# Altium schematic sheet MONO65_A2_s05 [Switches-2].SchDoc
size A3; DocumentNumber: 5; SheetNumber: 5; SheetTotal: 7
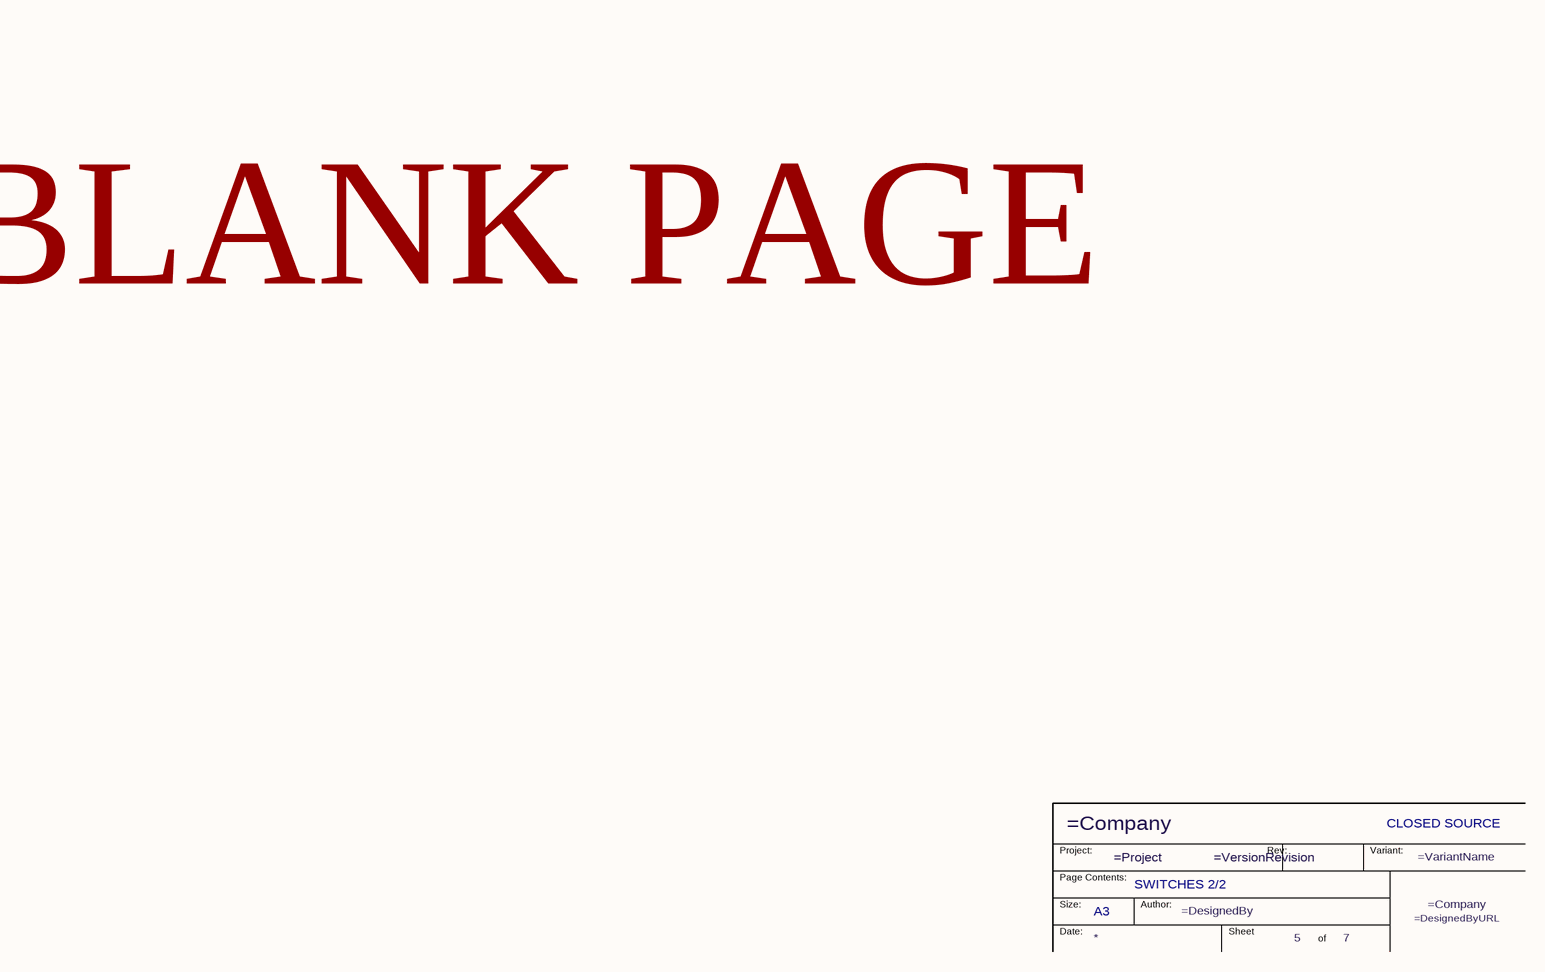
[diagram p0: MONO65_A2_s05 [Switches-2].SchDoc]

## Parts
TB*?  PageContents: SWITCHES 2/2  Licence: CLOSED SOURCE  Size: A3  (hidden comment: TBL TitleBlock 01)  (graphical)

## Notes on the sheet
- BLANK PAGE
- (in symbol TBL TitleBlock 01) Project:; Rev:; Variant:; Page Contents:; Size:; Author:; Date:; Sheet; of

## Library data of the parts
TB*? = TBL TitleBlock 01: Custom Title block